# Altium project ADS1299-ESP32-V3.PrjPcb
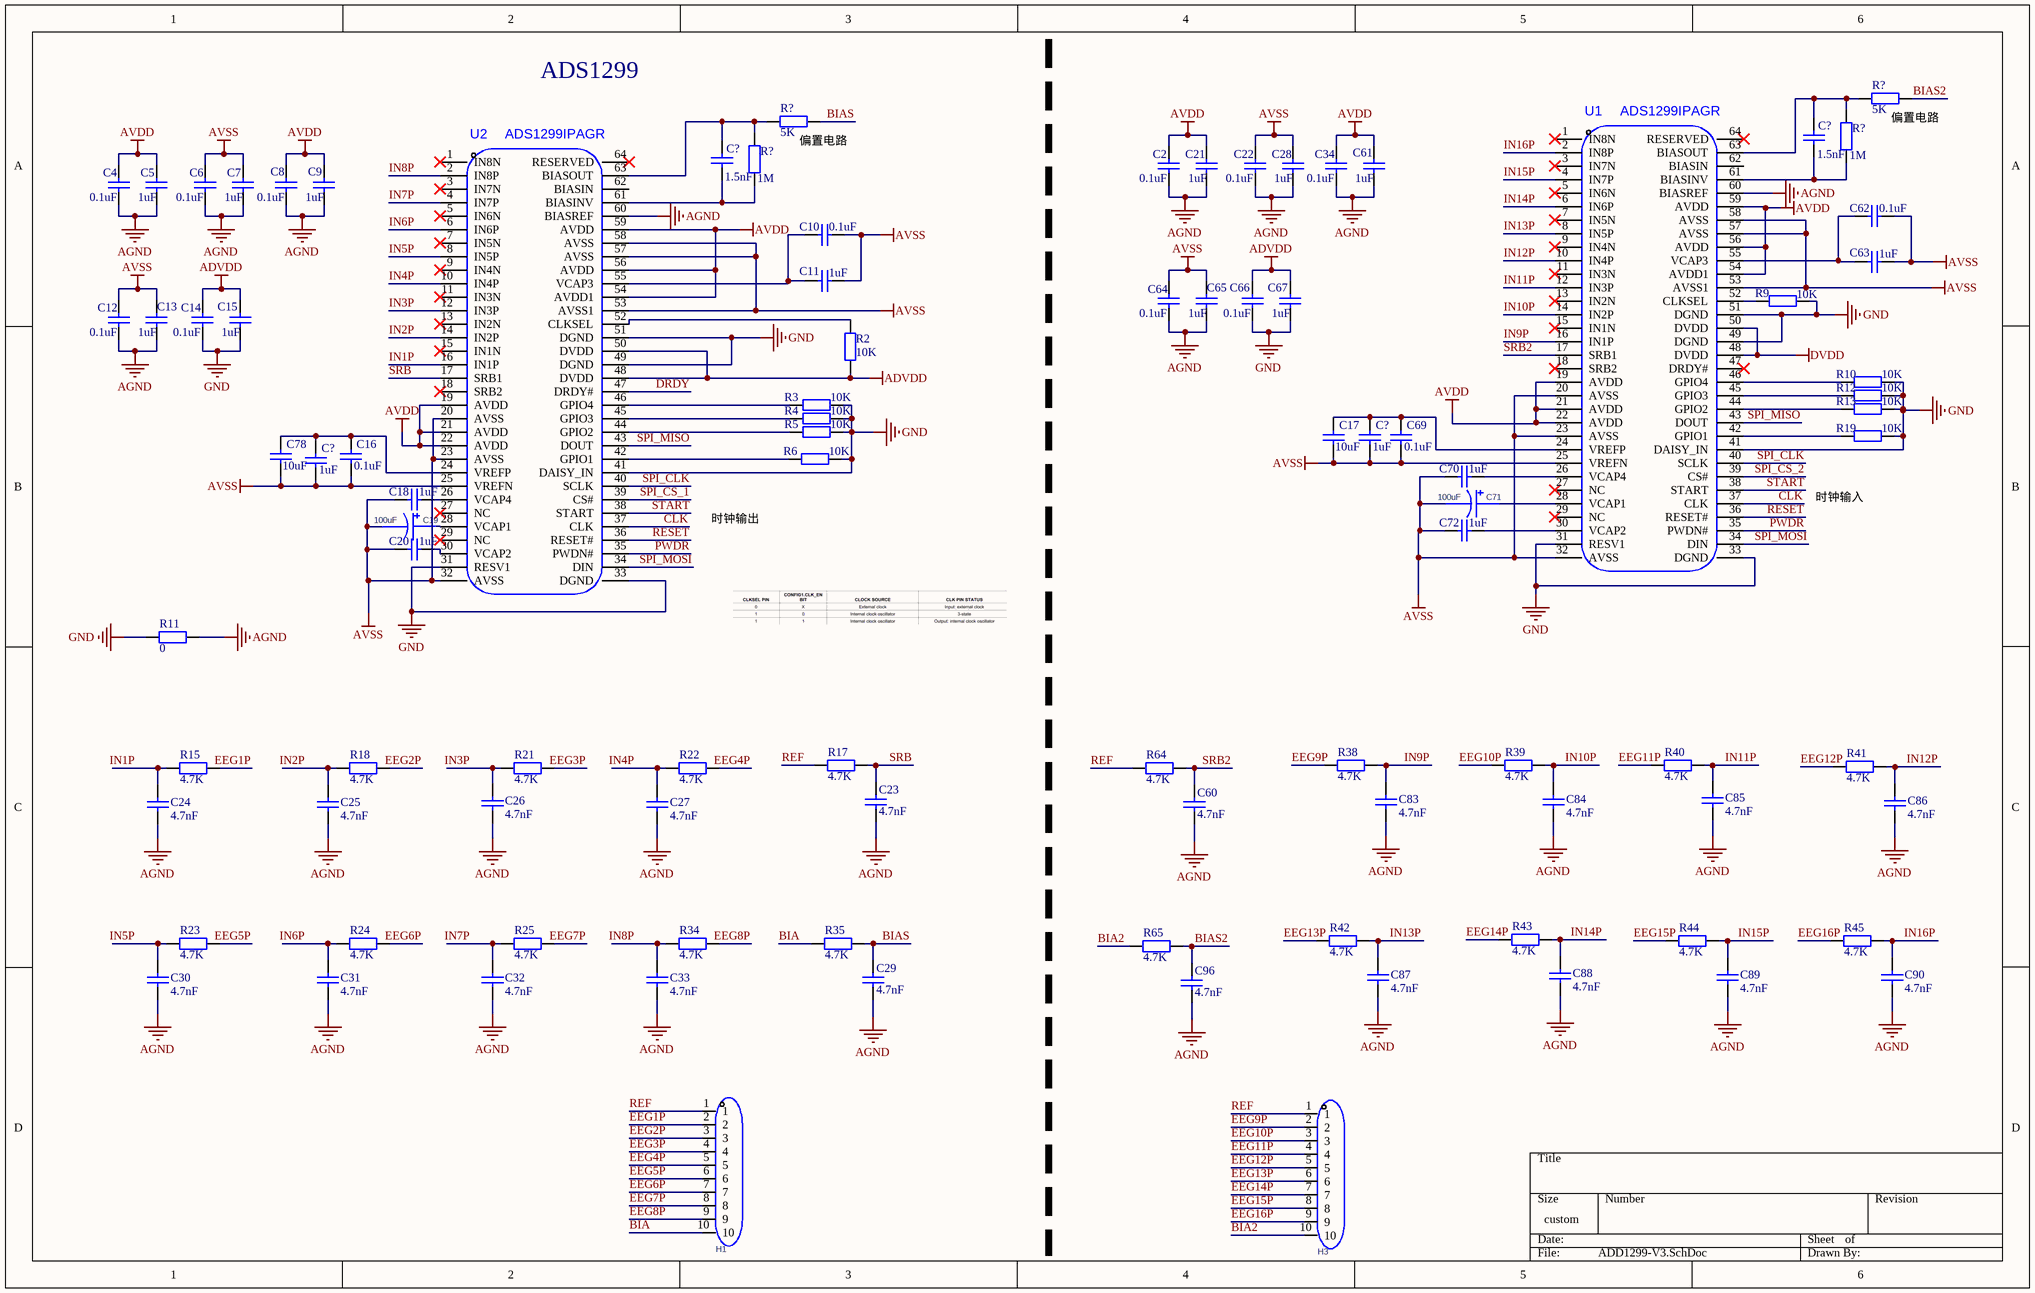
[diagram p0: ADD1299-V3.SchDoc]
3 sheets, 213 parts. Net scope: global (net labels, ports and power ports of the same name join across sheets).
Board file: ADS1299-V3.PcbDoc
Sheets:
  ADD1299-V3.SchDoc
  ESP32.SchDoc
  POWER.SchDoc

## Sheet ADD1299-V3.SchDoc
size 381 x 241 mm; SheetNumber: 1; SheetTotal: 3

### Parts
(Parts that share a designator on the sheet are numbered #1, #2 ... from top to bottom, then left to right.)
C2  0.1uF  [C0603]
C4  0.1uF  [C0603]
C5  1uF  [C0603]
C6  0.1uF  [C0603]
C7  1uF  [C0603]
C8  0.1uF  [C0603]
C9  1uF  [C0603]
C10  0.1uF  [C0603]
C11  1uF  [C0603]
C12  0.1uF  [C0603]
C13  1uF  [C0603]
C14  0.1uF  [C0603]
C15  1uF  [C0603]
C16  0.1uF  [C0603]
C17  10uF  [C0603]
C18  1uF  [C0603]
C19  100uF  [CASE-B_3528]
C20  1uF  [C0603]
C21  1uF  [C0603]
C22  0.1uF  [C0603]
C23  4.7nF  [C0603]
C24  4.7nF  [C0603]
C25  4.7nF  [C0603]
C26  4.7nF  [C0603]
C27  4.7nF  [C0603]
C28  1uF  [C0603]
C29  4.7nF  [C0603]
C30  4.7nF  [C0603]
C31  4.7nF  [C0603]
C32  4.7nF  [C0603]
C33  4.7nF  [C0603]
C34  0.1uF  [C0603]
C60  4.7nF  [C0603]
C61  1uF  [C0603]
C62  0.1uF  [C0603]
C63  1uF  [C0603]
C64  0.1uF  [C0603]
C65  1uF  [C0603]
C66  0.1uF  [C0603]
C67  1uF  [C0603]
C69  0.1uF  [C0603]
C70  1uF  [C0603]
C71  100uF  [CASE-B_3528]
C72  1uF  [C0603]
C78  10uF  [C0603]
C83  4.7nF  [C0603]
C84  4.7nF  [C0603]
C85  4.7nF  [C0603]
C86  4.7nF  [C0603]
C87  4.7nF  [C0603]
C88  4.7nF  [C0603]
C89  4.7nF  [C0603]
C90  4.7nF  [C0603]
C96  4.7nF  [C0603]
C?#1  1.5nF  [C0603]
C?#2  1.5nF  [C0603]
C?#3  1uF  [C0603]
C?#4  1uF  [C0603]
H1  PZ254V-11-10P  [HDR-TH_10P-P2.54-V-M]  (value not drawn)
H3  PZ254V-11-10P  [HDR-TH_10P-P2.54-V-M]  (value not drawn)
R2  10K  [R0603]
R3  10K  [R0603]
R4  10K  [R0603]
R5  10K  [R0603]
R6  10K  [R0603]
R9  10K  [R0603]
R10  10K  [R0603]
R11  0  [R0805]
R12  10K  [R0603]
R13  10K  [R0603]
R15  4.7K  [R0603]
R17  4.7K  [R0603]
R18  4.7K  [R0603]
R19  10K  [R0603]
R21  4.7K  [R0603]
R22  4.7K  [R0603]
R23  4.7K  [R0603]
R24  4.7K  [R0603]
R25  4.7K  [R0603]
R34  4.7K  [R0603]
R35  4.7K  [R0603]
R38  4.7K  [R0603]
R39  4.7K  [R0603]
R40  4.7K  [R0603]
R41  4.7K  [R0603]
R42  4.7K  [R0603]
R43  4.7K  [R0603]
R44  4.7K  [R0603]
R45  4.7K  [R0603]
R64  4.7K  [R0603]
R65  4.7K  [R0603]
R?#1  5K  [R0603]
R?#2  5K  [R0603]
R?#3  1M  [R0603]
R?#4  1M  [R0603]
U1  ADS1299IPAGR  [ADS1299]
U2  ADS1299IPAGR  [ADS1299]

### Nets
ADVDD: C14.1 C15.1 C66.1 C67.1 R2.1 U2.48(DVDD) U2.50(DVDD)
AGND: C2.2 C4.2 C5.2 C6.2 C7.2 C8.2 C9.2 C12.2 C13.2 C21.2 C22.2 C23.1 C24.2 C25.2 C26.2 C27.2 C28.2 C29.1 C30.2 C31.2 C32.2 C33.2 C34.2 C60.1 C61.2 C64.2 C65.2 C83.2 C84.2 C85.2 C86.2 C87.2 C88.2 C89.2 C90.2 C96.1 R11.1 U1.60(BIASREF) U2.60(BIASREF)
AVDD: C2.1 C4.1 C5.1 C8.1 C9.1 C21.1 C34.1 C61.1 U1.19(AVDD) U1.21(AVDD) U1.22(AVDD) U1.54(AVDD1) U1.56(AVDD) U1.59(AVDD) U2.19(AVDD) U2.21(AVDD) U2.22(AVDD) U2.54(AVDD1) U2.56(AVDD) U2.59(AVDD)
AVSS: C6.1 C7.1 C10.2 C11.2 C12.1 C13.1 C16.1 C17.1 C18.1 C19.2 C20.1 C22.1 C28.1 C62.2 C63.2 C64.1 C65.1 C69.1 C70.1 C71.2 C72.1 C78.1 C?#3.1 C?#4.1 U1.20(AVSS) U1.23(AVSS) U1.25(VREFN) U1.32(AVSS) U1.53(AVSS1) U1.57(AVSS) U1.58(AVSS) U2.20(AVSS) U2.23(AVSS) U2.25(VREFN) U2.32(AVSS) U2.53(AVSS1) U2.57(AVSS) U2.58(AVSS)
DVDD: U1.48(DVDD) U1.50(DVDD)
GND: C14.2 C15.2 C66.2 C67.2 R3.2 R4.2 R5.2 R6.2 R9.1 R10.2 R11.2 R12.2 R13.2 R19.2 U1.31(RESV1) U1.33(DGND) U1.41(DAISY_IN) U1.49(DGND) U1.51(DGND) U2.31(RESV1) U2.33(DGND) U2.41(DAISY_IN) U2.49(DGND) U2.51(DGND)
BIA: H1.10 R35.2
BIA2: H3.10 R65.2
BIAS: C29.2 R35.1 R?#2.2
BIAS2: C96.2 R65.1 R?#1.2
CLK: U1.37(CLK) U2.37(CLK)
DRDY: U2.47(DRDY#)
EEG1P: H1.2 R15.1
EEG2P: H1.3 R18.1
EEG3P: H1.4 R21.1
EEG4P: H1.5 R22.1
EEG5P: H1.6 R23.1
EEG6P: H1.7 R24.1
EEG7P: H1.8 R25.1
EEG8P: H1.9 R34.1
EEG9P: H3.2 R38.1
EEG10P: H3.3 R39.1
EEG11P: H3.4 R40.1
EEG12P: H3.5 R41.1
EEG13P: H3.6 R42.1
EEG14P: H3.7 R43.1
EEG15P: H3.8 R44.1
EEG16P: H3.9 R45.1
IN1P: C24.1 R15.2 U2.16(IN1P)
IN2P: C25.1 R18.2 U2.14(IN2P)
IN3P: C26.1 R21.2 U2.12(IN3P)
IN4P: C27.1 R22.2 U2.10(IN4P)
IN5P: C30.1 R23.2 U2.8(IN5P)
IN6P: C31.1 R24.2 U2.6(IN6P)
IN7P: C32.1 R25.2 U2.4(IN7P)
IN8P: C33.1 R34.2 U2.2(IN8P)
IN9P: C83.1 R38.2 U1.16(IN1P)
IN10P: C84.1 R39.2 U1.14(IN2P)
IN11P: C85.1 R40.2 U1.12(IN3P)
IN12P: C86.1 R41.2 U1.10(IN4P)
IN13P: C87.1 R42.2 U1.8(IN5P)
IN14P: C88.1 R43.2 U1.6(IN6P)
IN15P: C89.1 R44.2 U1.4(IN7P)
IN16P: C90.1 R45.2 U1.2(IN8P)
PWDR: U1.35(PWDN#) U2.35(PWDN#)
REF: H1.1 H3.1 R17.2 R64.2
RESET: U1.36(RESET#) U2.36(RESET#)
SPI_CLK: U1.40(SCLK) U2.40(SCLK)
SPI_CS_1: U2.39(CS#)
SPI_CS_2: U1.39(CS#)
SPI_MISO: U1.43(DOUT) U2.43(DOUT)
SPI_MOSI: U1.34(DIN) U2.34(DIN)
SRB: C23.2 R17.1 U2.17(SRB1)
SRB2: C60.2 R64.1 U1.17(SRB1)
START: U1.38(START) U2.38(START)
NetC10_1: C10.1 C11.1 U2.55(VCAP3)
NetC16_2: C16.2 C78.2 C?#4.2 U2.24(VREFP)
NetC17_2: C17.2 C69.2 C?#3.2 U1.24(VREFP)
NetC18_2: C18.2 U2.26(VCAP4)
NetC19_1: C19.1 U2.28(VCAP1)
NetC20_2: C20.2 U2.30(VCAP2)
NetC62_1: C62.1 C63.1 U1.55(VCAP3)
NetC70_2: C70.2 U1.26(VCAP4)
NetC71_1: C71.1 U1.28(VCAP1)
NetC72_2: C72.2 U1.30(VCAP2)
NetC?#1_1: C?#1.1 R?#1.1 R?#3.1 U1.63(BIASOUT)
NetC?#1_2: C?#1.2 R?#3.2 U1.61(BIASINV)
NetC?#2_1: C?#2.1 R?#2.1 R?#4.1 U2.63(BIASOUT)
NetC?#2_2: C?#2.2 R?#4.2 U2.61(BIASINV)
NetR2_2: R2.2 U2.52(CLKSEL)
NetR3_1: R3.1 U2.46(GPIO4)
NetR4_1: R4.1 U2.45(GPIO3)
NetR5_1: R5.1 U2.44(GPIO2)
NetR6_1: R6.1 U2.42(GPIO1)
NetR9_2: R9.2 U1.52(CLKSEL)
NetR10_1: R10.1 U1.46(GPIO4)
NetR12_1: R12.1 U1.45(GPIO3)
NetR13_1: R13.1 U1.44(GPIO2)
NetR19_1: R19.1 U1.42(GPIO1)

Not connected (* = marked no-connect by the designer): U1 1(IN8N)* 3(IN7N)* 5(IN6N)* 7(IN5N)* 9(IN4N)* 11(IN3N)* 13(IN2N)* 15(IN1N)* 18(SRB2)* 27(NC)* 29(NC)* 47(DRDY#)* 62(BIASIN) 64(RESERVED)*; U2 1(IN8N)* 3(IN7N)* 5(IN6N)* 7(IN5N)* 9(IN4N)* 11(IN3N)* 13(IN2N)* 15(IN1N)* 18(SRB2)* 27(NC)* 29(NC)* 62(BIASIN) 64(RESERVED)*

### Notes on the sheet
- ADS1299
- (near R?#2) 偏置电路
- (near R?#1) 偏置电路
- 时钟输入
- 时钟输出

### Library data of the parts
C2 C4 C6 C8 C10 C12 C14 C16 C22 C34 C62 C64 C66 C69 C?#3 C?#4 = C0603: CAP CER 0.1UF 50V, 10% X7R 0603; Value: 104; Published: 8-Jun-2000; LatestRevisionDate: 17-Jul-2002; LatestRevisionNote: Re-released for DXP Platform.; Publisher: Altium Limited
C5 C7 C9 C11 C13 C15 C18 C20 C21 C28 C61 C63 C65 C67 C70 C72 = C0603: CAP CER 1UF 25V, 10% X5R 0603; Value: 104; Published: 8-Jun-2000; LatestRevisionDate: 17-Jul-2002; LatestRevisionNote: Re-released for DXP Platform.; Publisher: Altium Limited
C17 = C0603: AP CER 10UF 10V, 10% X5R 0603; Value: 104; Published: 8-Jun-2000; LatestRevisionDate: 17-Jul-2002; LatestRevisionNote: Re-released for DXP Platform.; Publisher: Altium Limited
C19 C71 = T491B107K010AT: Manufacturer: KEMET(基美); Add into BOM: yes; Tolerance: ±10%; Rated Voltage: 10V; Equivalent Series Resistance(ESR): 1.2Ω@100kHz; Symbol: T491B107K010AT; Device: T491B107K010AT; LCSC Part Name: 100uF ±10% 10V; Supplier Part: C122271; Manufacturer Part: T491B107K010AT; Supplier Footprint: CASE-B-3528; JLCPCB Part Class: Extended Part; Datasheet: https://atta.szlcsc.com/upload/public/pdf/source/20171212/C146203_15130638656111177810.pdf; Supplier: LCSC; Convert to PCB: yes; Value: 100uF; Operating Temperature: -55℃~+125℃
C23-C27 C29-C33 C60 C83-C90 C96 = C0603: CAP CER 4700PF 50V, 10% X7R 0603; Value: 104; Published: 8-Jun-2000; LatestRevisionDate: 17-Jul-2002; LatestRevisionNote: Re-released for DXP Platform.; Publisher: Altium Limited
C78 = C0603: Capacitor; Value: 104; Published: 8-Jun-2000; LatestRevisionDate: 17-Jul-2002; LatestRevisionNote: Re-released for DXP Platform.; Publisher: Altium Limited
C?#1 C?#2 = C0603: CAP CER 1.5NF 25V, 10% X7R 0603; Value: 104; Published: 8-Jun-2000; LatestRevisionDate: 17-Jul-2002; LatestRevisionNote: Re-released for DXP Platform.; Publisher: Altium Limited
H1 H3 = PZ254V-11-10P: Manufacturer: XFCN(兴飞); Add into BOM: yes; Pin Structure: 1x10P; Pitch: 2.54mm; Circluar Pins/Square Pins: 方针; Symbol: PZ254V-11-10P; Device: PZ254V-11-10P; LCSC Part Name: 1x10P 间距:2.54mm 方针 直插; Supplier Part: C492409; Manufacturer Part: PZ254V-11-10P; Supplier Footprint: 插件,P=2.54mm; JLCPCB Part Class: Extended Part; Datasheet: https://atta.szlcsc.com/upload/public/pdf/source/20200309/C492409_129C9431BDD62EBBBD0A643B6AAB9FBD.pdf; Supplier: LCSC; Convert to PCB: yes; Row Spacing: -; Mounting Type: 直插; Number of Rows: 单排; Number of Pins: 10P; Current Rating: -; Voltage Rating (Max): -; Length of Mating Pin: 6mm; Insulation Height: 2.5mm; Length of End Connection Pin: 3mm; Contact Material: 黄铜; Contact Plating: -; Operating Temperature: -40℃~+105℃; Color: 黑色
R2-R6 R9 R10 R12 R13 R19 = R0603: RES 10.0K OHM 1/10W 1% 0603 SMD; Published: 8-Jun-2000; LatestRevisionDate: 17-Jul-2002; LatestRevisionNote: Re-released for DXP Platform.; Publisher: Altium Limited
R11 = R0805: 磁珠; Published: 8-Jun-2000; LatestRevisionDate: 17-Jul-2002; LatestRevisionNote: Re-released for DXP Platform.; Publisher: Altium Limited
R15 R17 R18 R21-R25 R34 R35 R38-R45 R64 R65 = R0603: RES 4.7K OHM 1/10W 1% 0603 SMD; Published: 8-Jun-2000; LatestRevisionDate: 17-Jul-2002; LatestRevisionNote: Re-released for DXP Platform.; Publisher: Altium Limited
R?#1 R?#2 = R0603: 薄膜电阻 5kΩ ±0.1% 100mW; Published: 8-Jun-2000; LatestRevisionDate: 17-Jul-2002; LatestRevisionNote: Re-released for DXP Platform.; Publisher: Altium Limited
R?#3 R?#4 = R0603: RES 1M OHM 1/8W 5% 0603 SMD; Published: 8-Jun-2000; LatestRevisionDate: 17-Jul-2002; LatestRevisionNote: Re-released for DXP Platform.; Publisher: Altium Limited
U1 U2 = ADS1299IPAGR: Manufacturer: TI(德州仪器); Add into BOM: yes; Supply Voltage: 5V；1.8V~3.6V; Symbol: ADS1299IPAGR; Device: ADS1299IPAGR; LCSC Part Name: ADS1299-x 低噪声、4/6/8通道、24bit 、同时采样模数转换器，用于EEG和生物电bit 测量; Supplier Part: C476817; Manufacturer Part: ADS1299IPAGR; Supplier Footprint: TQFP-64(10x10); JLCPCB Part Class: Extended Part; Datasheet: https://www.ti.com/cn/lit/gpn/ads1299; Supplier: LCSC; Convert to PCB: yes

## Sheet ESP32.SchDoc
size 381 x 241 mm; SheetNumber: 2; SheetTotal: 3
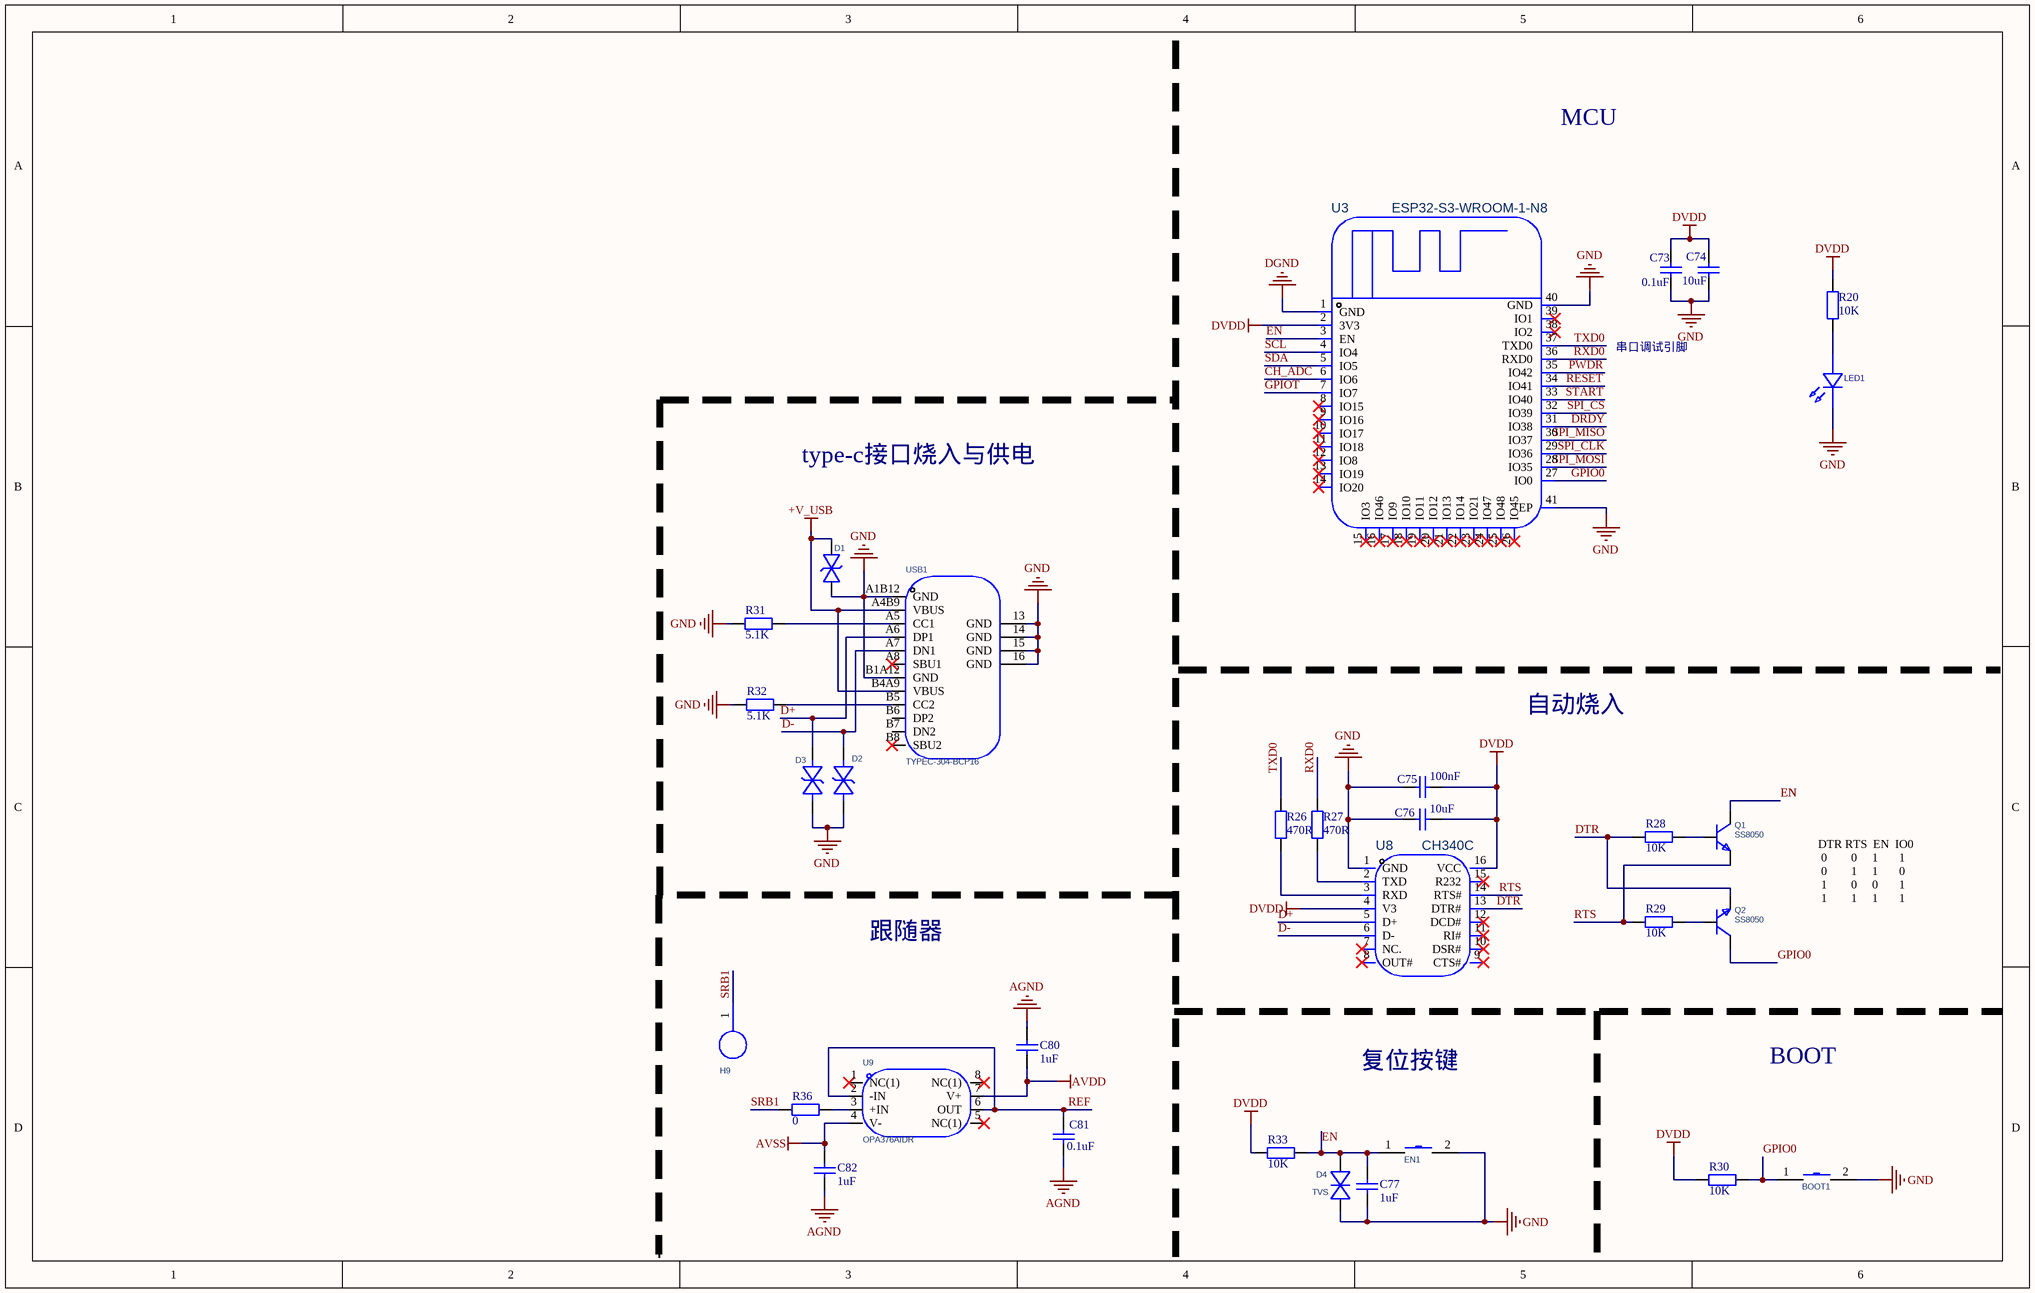
[diagram p1: ESP32.SchDoc]

### Parts
BOOT1  TS-1101-C-W  [SW-SMD_L6.0-W3.3-LS8.0]  (value not drawn)
C73  0.1uF  [C0603]
C74  10uF  [C0603]
C75  100nF  [C0603]
C76  10uF  [C0603]
C77  1uF  [C0603]
C80  1uF  [C0603]
C81  0.1uF  [C0603]
C82  1uF  [C0603]
D1  SMBJ5.0CA  [SMB_L4.5-W3.6-LS5.2-BI]  (value not drawn)
D2  ESD8011MUT5G(ES)  [X3-DFN0603-2_L0.6-W0.3-BI]  (value not drawn)
D3  ESD8011MUT5G(ES)  [X3-DFN0603-2_L0.6-W0.3-BI]  (value not drawn)
D4  TVS  [SMB_L4.3-W3.6-LS5.4-BI]
EN1  TS-1101-C-W  [SW-SMD_L6.0-W3.3-LS8.0]  (value not drawn)
H9  PZ254V-11-01P  [HDR-TH_1P-P2.54-V-M]  (value not drawn)
LED1  XL-1608SURC-06  [LED0603-RD_RED]  (value not drawn)
Q1  SS8050  [SOT-23-3_L2.9-W1.3-P1.90-LS2.4-BR]
Q2  SS8050  [SOT-23-3_L2.9-W1.3-P1.90-LS2.4-BR]
R20  10K  [R0603]
R26  470R  [R0603]
R27  470R  [R0603]
R28  10K  [R0603]
R29  10K  [R0603]
R30  10K  [R0603]
R31  5.1K  [R0603]
R32  5.1K  [R0603]
R33  10K  [R0603]
R36  0  [R0805]
U3  ESP32-S3-WROOM-1-N8  [WIFIM-SMD_ESP32-S3-WROOM-1-N8]
U8  CH340C  [SOP-16_L10.0-W3.9-P1.27-LS6.0-BL]
U9  OPA376AIDR  [SOIC-8_L4.9-W3.9-P1.27-LS6.0-BL]
USB1  TYPEC-304-BCP16  [USB-C-SMD_TYPEC-304-BCP16]

### Nets
+V_USB: D1.2 USB1.A4B9(VBUS) USB1.B4A9(VBUS)
AGND: C80.2 C81.1 C82.2
AVDD: C80.1 U9.7(V+)
AVSS: C82.1 U9.4(V-)
DGND: U3.1(GND)
DVDD: C73.1 C74.1 C75.2 C76.2 R20.2 R30.1 R33.1 U3.2(3V3) U8.4(V3) U8.16(VCC)
GND: BOOT1.2 C73.2 C74.2 C75.1 C76.1 C77.2 D1.1 D2.1(C) D3.1(C) D4.1(C) EN1.2 LED1.1(K) R31.2 R32.2 U3.40(GND) U3.41(EP) U8.1(GND) USB1.13(GND) USB1.14(GND) USB1.15(GND) USB1.16(GND) USB1.A1B12(GND) USB1.B1A12(GND)
CH_ADC: U3.6(IO6)
D+: D3.2(A) U8.5(D+) USB1.A6(DP1)
D-: D2.2(A) U8.6(D-) USB1.A7(DN1)
DRDY: U3.31(IO38)
DTR: Q2.2(E) R28.1 U8.13(DTR#)
EN: C77.1 D4.2(A) EN1.1 Q1.3(C) R33.2 U3.3(EN)
GPIO0: BOOT1.1 Q2.3(C) R30.2 U3.27(IO0)
GPIOT: U3.7(IO7)
PWDR: U3.35(IO42)
REF: C81.2 U9.2(-IN) U9.6(OUT)
RESET: U3.34(IO41)
RTS: Q1.2(E) R29.1 U8.14(RTS#)
RXD0: R27.2 U3.36(RXD0)
SCL: U3.4(IO4)
SDA: U3.5(IO5)
SPI_CLK: U3.29(IO36)
SPI_CS: U3.32(IO39)
SPI_MISO: U3.30(IO37)
SPI_MOSI: U3.28(IO35)
SRB1: H9.1 R36.2
START: U3.33(IO40)
TXD0: R26.2 U3.37(TXD0)
NetLED1_2: LED1.2(A) R20.1
NetQ1_1: Q1.1(B) R28.2
NetQ2_1: Q2.1(B) R29.2
NetR26_1: R26.1 U8.3(RXD)
NetR27_1: R27.1 U8.2(TXD)
NetR31_1: R31.1 USB1.A5(CC1)
NetR32_1: R32.1 USB1.B5(CC2)
NetR36_1: R36.1 U9.3(+IN)

Not connected (* = marked no-connect by the designer): U3 8(IO15)* 9(IO16)* 10(IO17)* 11(IO18)* 12(IO8)* 13(IO19)* 14(IO20)* 15(IO3)* 16(IO46)* 17(IO9)* 18(IO10)* 19(IO11)* 20(IO12)* 21(IO13)* 22(IO14)* 23(IO21)* 24(IO47)* 25(IO48)* 26(IO45)* 38(IO2)* 39(IO1)*; U8 7(NC.)* 8(OUT#)* 9(CTS#)* 10(DSR#)* 11(RI#)* 12(DCD#)* 15(R232)*; U9 1(NC(1))* 5(NC(1))* 8(NC(1))*; USB1 A8(SBU1)* B6(DP2) B7(DN2) B8(SBU2)*

### Notes on the sheet
- MCU
- 串口调试引脚
- type-c接口烧入与供电
- 自动烧入
- DTR RTS  EN  IO0
  0        0     1       1
  0        1     1       0
  1        0     0       1
  1        1     1       1
- 跟随器
- 复位按键
- BOOT

### Library data of the parts
BOOT1 EN1 = TS-1101-C-W: Manufacturer: XKB Connectivity(中国星坤); Add into BOM: yes; Circuit: 单刀单掷; Actuator Style: 矩形按钮; Operating Force: 260gf; Switch Length: 6mm; Switch Width: 3.6mm; Switch Height: 2.5mm; Strike Gundam: 不带; Contact Current: 50mA; Voltage Rating (DC): 12V; Actuator/Cap Color: 白色带淡绿; With Lamp: 无; Mechanical Life: 5万次; Symbol: TS-1101-C-W; Device: TS-1101-C-W; LCSC Part Name: 6*3.6*2.5mm 立贴 轻触开关; Supplier Part: C318938; Manufacturer Part: TS-1101-C-W; Supplier Footprint: SMD; JLCPCB Part Class: Extended Part; Datasheet: https://atta.szlcsc.com/upload/public/pdf/source/20200227/C318938_C2E53B1EEDE37D980A33616AC086DE53.pdf; Supplier: LCSC; Convert to PCB: yes; Mounting Style: 立贴; Voltage Rating (AC): -; Power Rating: -; Insulation Resistance: -; IP Rating: -; Pin Style: -; Operating Temperature: -30℃~+85℃
C73 C81 = C0603: as C2 on sheet ADD1299-V3; Published: 8-Jun-2000; LatestRevisionDate: 17-Jul-2002; LatestRevisionNote: Re-released for DXP Platform.; Publisher: Altium Limited
C74 C75 = C0603: as C5 on sheet ADD1299-V3; Published: 8-Jun-2000; LatestRevisionDate: 17-Jul-2002; LatestRevisionNote: Re-released for DXP Platform.; Publisher: Altium Limited
C76 = C0603: CAP CER 10UF 25V, 10% X5R 0603; Value: 104; Published: 8-Jun-2000; LatestRevisionDate: 17-Jul-2002; LatestRevisionNote: Re-released for DXP Platform.; Publisher: Altium Limited
C77 C80 C82 = C0603: CAP CER 1UF 25V, 10% X7R 0603; Value: 104; Published: 8-Jun-2000; LatestRevisionDate: 17-Jul-2002; LatestRevisionNote: Re-released for DXP Platform.; Publisher: Altium Limited
D1 = SMBJ5.0CA_C19077559: PWR; Manufacturer: 宏嘉诚; Add into BOM: yes; Polarity: 双向; Reverse Stand-Off Voltage (Vrwm): 5V; Clamping Voltage: 9.2V; Peak Pulse Current (Ipp): 65.22A; Peak Pulse Power Dissipation (Ppp): 600W; Voltage - Breakdown: 7V; Reverse Leakage Current (Ir): 800uA; Type: TVS; Symbol: SMBJ5.0CA_C19077559; Device: SMBJ5.0CA_C19077559; LCSC Part Name: SMBJ5.0CA; Supplier Part: C19077559; Manufacturer Part: SMBJ5.0CA; Supplier Footprint: SMB; JLCPCB Part Class: Extended Part; Datasheet: https://atta.szlcsc.com/upload/public/pdf/source/20250107/474F05451FC8AB27D7FA0238914F96F6.pdf; Supplier: LCSC; Convert to PCB: yes; Operating Temperature: -
D2 D3 = ESD8011MUT5G(ES): 高速低电容; Manufacturer: ElecSuper(静芯微); Add into BOM: yes; Reverse Stand-Off Voltage (Vrwm): 5V; Clamping Voltage: 5.5V; Peak Pulse Current (Ipp): 4.5A; Peak Pulse Power Dissipation (Ppp): 40W; Voltage - Breakdown: 7.8V; Reverse Leakage Current (Ir): 100nA; Symbol: ESD8011MUT5G(ES); Device: ESD8011MUT5G(ES); LCSC Part Name: 极低电容0.1pF，1.0/1.5/3.3/5.0V深回扫超低电容超低钳位单路双向ESD防护器件，4.5A、10kV、0.1pF；Thounderbolt5、USB4.0 80G-120G信号线超高速通讯防护。; Supplier Part: C42400200; Manufacturer Part: ESD8011MUT5G(ES); Supplier Footprint: DFN0603-2L; Datasheet: https://atta.szlcsc.com/upload/public/pdf/source/20241127/8BB72D6002C01DA826D69227B9BFDA64.pdf; Supplier: LCSC; Convert to PCB: yes; Operating Temperature: -50℃~+125℃
D4 = SMBJ3.3CA_C19077557: 3.3V KEY; Manufacturer: 宏嘉诚; Add into BOM: yes; Polarity: 双向; Clamping Voltage: 8V; Peak Pulse Current (Ipp): 75A; Peak Pulse Power Dissipation (Ppp): 600W; Voltage - Breakdown: 6.5V; Reverse Leakage Current (Ir): 600uA; Symbol: SMBJ3.3CA_C19077557; Device: SMBJ3.3CA_C19077557; LCSC Part Name: SMBJ3.3CA; Supplier Part: C19077557; Manufacturer Part: SMBJ3.3CA; Supplier Footprint: SMB; JLCPCB Part Class: Extended Part; Datasheet: https://atta.szlcsc.com/upload/public/pdf/source/20250107/474F05451FC8AB27D7FA0238914F96F6.pdf; Supplier: LCSC; Convert to PCB: yes; Reverse Stand-Off Voltage (Vrwm): 3.3V; Operating Temperature: -; Type: TVS
H9 = PZ254V-11-01P: Manufacturer: XFCN(兴飞); Add into BOM: yes; Pin Structure: 1x1P; Pitch: 2.54mm; Circluar Pins/Square Pins: 方针; Symbol: PZ254V-11-01P; Device: PZ254V-11-01P; LCSC Part Name: 1x1P 间距:2.54mm 方针 直插; Supplier Part: C492400; Manufacturer Part: PZ254V-11-01P; Supplier Footprint: 插件,P=2.54mm; JLCPCB Part Class: Extended Part; Datasheet: https://atta.szlcsc.com/upload/public/pdf/source/20200309/C492400_46876A5B545F5AE6B8D4A09C46E276E8.pdf; Supplier: LCSC; Convert to PCB: yes; Row Spacing: -; Mounting Type: 直插; Number of Rows: 单排; Number of Pins: 1P; Current Rating: -; Voltage Rating (Max): -; Length of Mating Pin: 6mm; Insulation Height: 2.5mm; Length of End Connection Pin: 3mm; Contact Material: 黄铜; Contact Plating: -; Operating Temperature: -40℃~+105℃; Color: 黑色
LED1 = XL-1608SURC-06: Manufacturer: XINGLIGHT(成兴光); Add into BOM: yes; Illumination Color: 红色; Voltage - Forward(Vf): 2.3V; Power(Watts): 50mW; Forward Current: 20mA; Wavelength - Dominant: 620nm~630nm; Peak Wavelength: 625nm; Lens Color: 无色透明透镜; Luminous Intensity: 225mcd; Viewing Angle: 120°; Mounting Sytle: 正贴; Symbol: XL-1608SURC-06; Device: XL-1608SURC-06; LCSC Part Name: XL-1608SURC-06; Supplier Part: C965799; Manufacturer Part: XL-1608SURC-06; Supplier Footprint: 0603; JLCPCB Part Class: Extended Part; Datasheet: https://atta.szlcsc.com/upload/public/pdf/source/20250213/F9766CE804AF391355DCDD48DB3E0DAB.pdf; Supplier: LCSC; Convert to PCB: yes; Lamp Holder Type: -; Diode Configuration: -; Color Temperature: -; Operating Temperature: -20℃~+85℃
Q1 Q2 = SS8050_C7420370: NPN; Manufacturer: 宏嘉诚; Add into BOM: yes; Current - Collector(Ic): 1.5A; Collector - Emitter Voltage VCEO: 25V; Pd - Power Dissipation: 300mW; DC Current Gain: 120@100mA,1.0V; Transition frequency(fT): 100MHz; Current - Collector Cutoff: 100nA; Vce Saturation(VCE(sat)): 500mV; Symbol: SS8050_C7420370; Device: SS8050_C7420370; LCSC Part Name: H档 200-350; Supplier Part: C7420370; Manufacturer Part: SS8050; Supplier Footprint: SOT-23; JLCPCB Part Class: Extended Part; Datasheet: https://atta.szlcsc.com/upload/public/pdf/source/20250205/5DB94E86981B5B1A1866D18E379C0D4F.pdf; Supplier: LCSC; Convert to PCB: yes; type: NPN; Operating Temperature: -55℃~+150℃
R20 R26-R33 = R0603: Resistor; Published: 8-Jun-2000; LatestRevisionDate: 17-Jul-2002; LatestRevisionNote: Re-released for DXP Platform.; Publisher: Altium Limited
R36 = R0805: RES 0 OHM 1/8W 1% 0805 SMD; Published: 8-Jun-2000; LatestRevisionDate: 17-Jul-2002; LatestRevisionNote: Re-released for DXP Platform.; Publisher: Altium Limited
U3 = ESP32-S3-WROOM-1-N8: Manufacturer: ESPRESSIF(乐鑫); Add into BOM: yes; Core Processor: ESP32-S3芯片; Support Interface: I2C；GPIO；SPI；PWM；ADC；UART；USB；I2S; Value: 2.4GHz; Symbol: ESP32-S3-WROOM-1-N8; Device: ESP32-S3-WROOM-1-N8; LCSC Part Name: 通用型Wi-Fi+低功耗蓝牙MCU模组; Supplier Part: C2913198; Manufacturer Part: ESP32-S3-WROOM-1-N8; Supplier Footprint: SMD,18x25.5mm; JLCPCB Part Class: Extended Part; Datasheet: https://atta.szlcsc.com/upload/public/pdf/source/20221026/9A44C6421221D672346AAE72DF9F8146.pdf; Supplier: LCSC; Convert to PCB: yes
U8 = CH340C: Manufacturer: WCH(南京沁恒); Add into BOM: yes; Applications Function: 收发器; Protocol: USB 2.0; Voltage - Supply: 3.3V；5V; Data Rate: 2Mbps; Symbol: CH340C; Device: CH340C; LCSC Part Name: CH340C; Supplier Part: C84681; Manufacturer Part: CH340C; Supplier Footprint: SOP-16; JLCPCB Part Class: Extended Part; Datasheet: https://atta.szlcsc.com/upload/public/pdf/source/20240619/63986D8440D4E5267A77ACD891CC4DE3.pdf; Supplier: LCSC; Convert to PCB: yes
U9 = OPA376AIDR: Manufacturer: TI(德州仪器); Add into BOM: yes; Number of Channels: 单路; Gain Bandwidth Product: 5.5MHz; Ib - Input Bias Current: 0.2pA; Slew Rate: 2V/us; Output Current: 50mA; Symbol: OPA376AIDR; Device: OPA376AIDR; LCSC Part Name: OPA376AIDR; Supplier Part: C2058339; Manufacturer Part: OPA376AIDR; Supplier Footprint: SOIC-8; JLCPCB Part Class: Extended Part; Datasheet: https://www.ti.com/cn/lit/gpn/opa2376; Supplier: LCSC; Convert to PCB: yes; Output Type: -; Rail to Rail: -; Operating Temperature: -40℃~+125℃
USB1 = TYPEC-304-BCP16_C720629: Manufacturer: XUNPU(讯普); Add into BOM: yes; Connector Type: Type-C; Protocol Standard: USB 3.1; Gender: 母; Number of Contacts: 16P; Number of Ports: 1; Current Rating-Power: 3A; Symbol: TYPEC-304-BCP16; Device: TYPEC-304-BCP16_C720629; LCSC Part Name: 停产 Type-C 母 卧贴; Supplier Part: C720629; Manufacturer Part: TYPEC-304-BCP16; Supplier Footprint: SMD; JLCPCB Part Class: Extended Part; Datasheet: https://atta.szlcsc.com/upload/public/pdf/source/20220210/1FE0FEFF7D6A20C111212527D3DED014.pdf; Supplier: LCSC; Convert to PCB: yes; Mounting Type: 卧贴; Operating Temperature: -25℃~+85℃

## Sheet POWER.SchDoc
size 381 x 241 mm; SheetNumber: 3; SheetTotal: 3
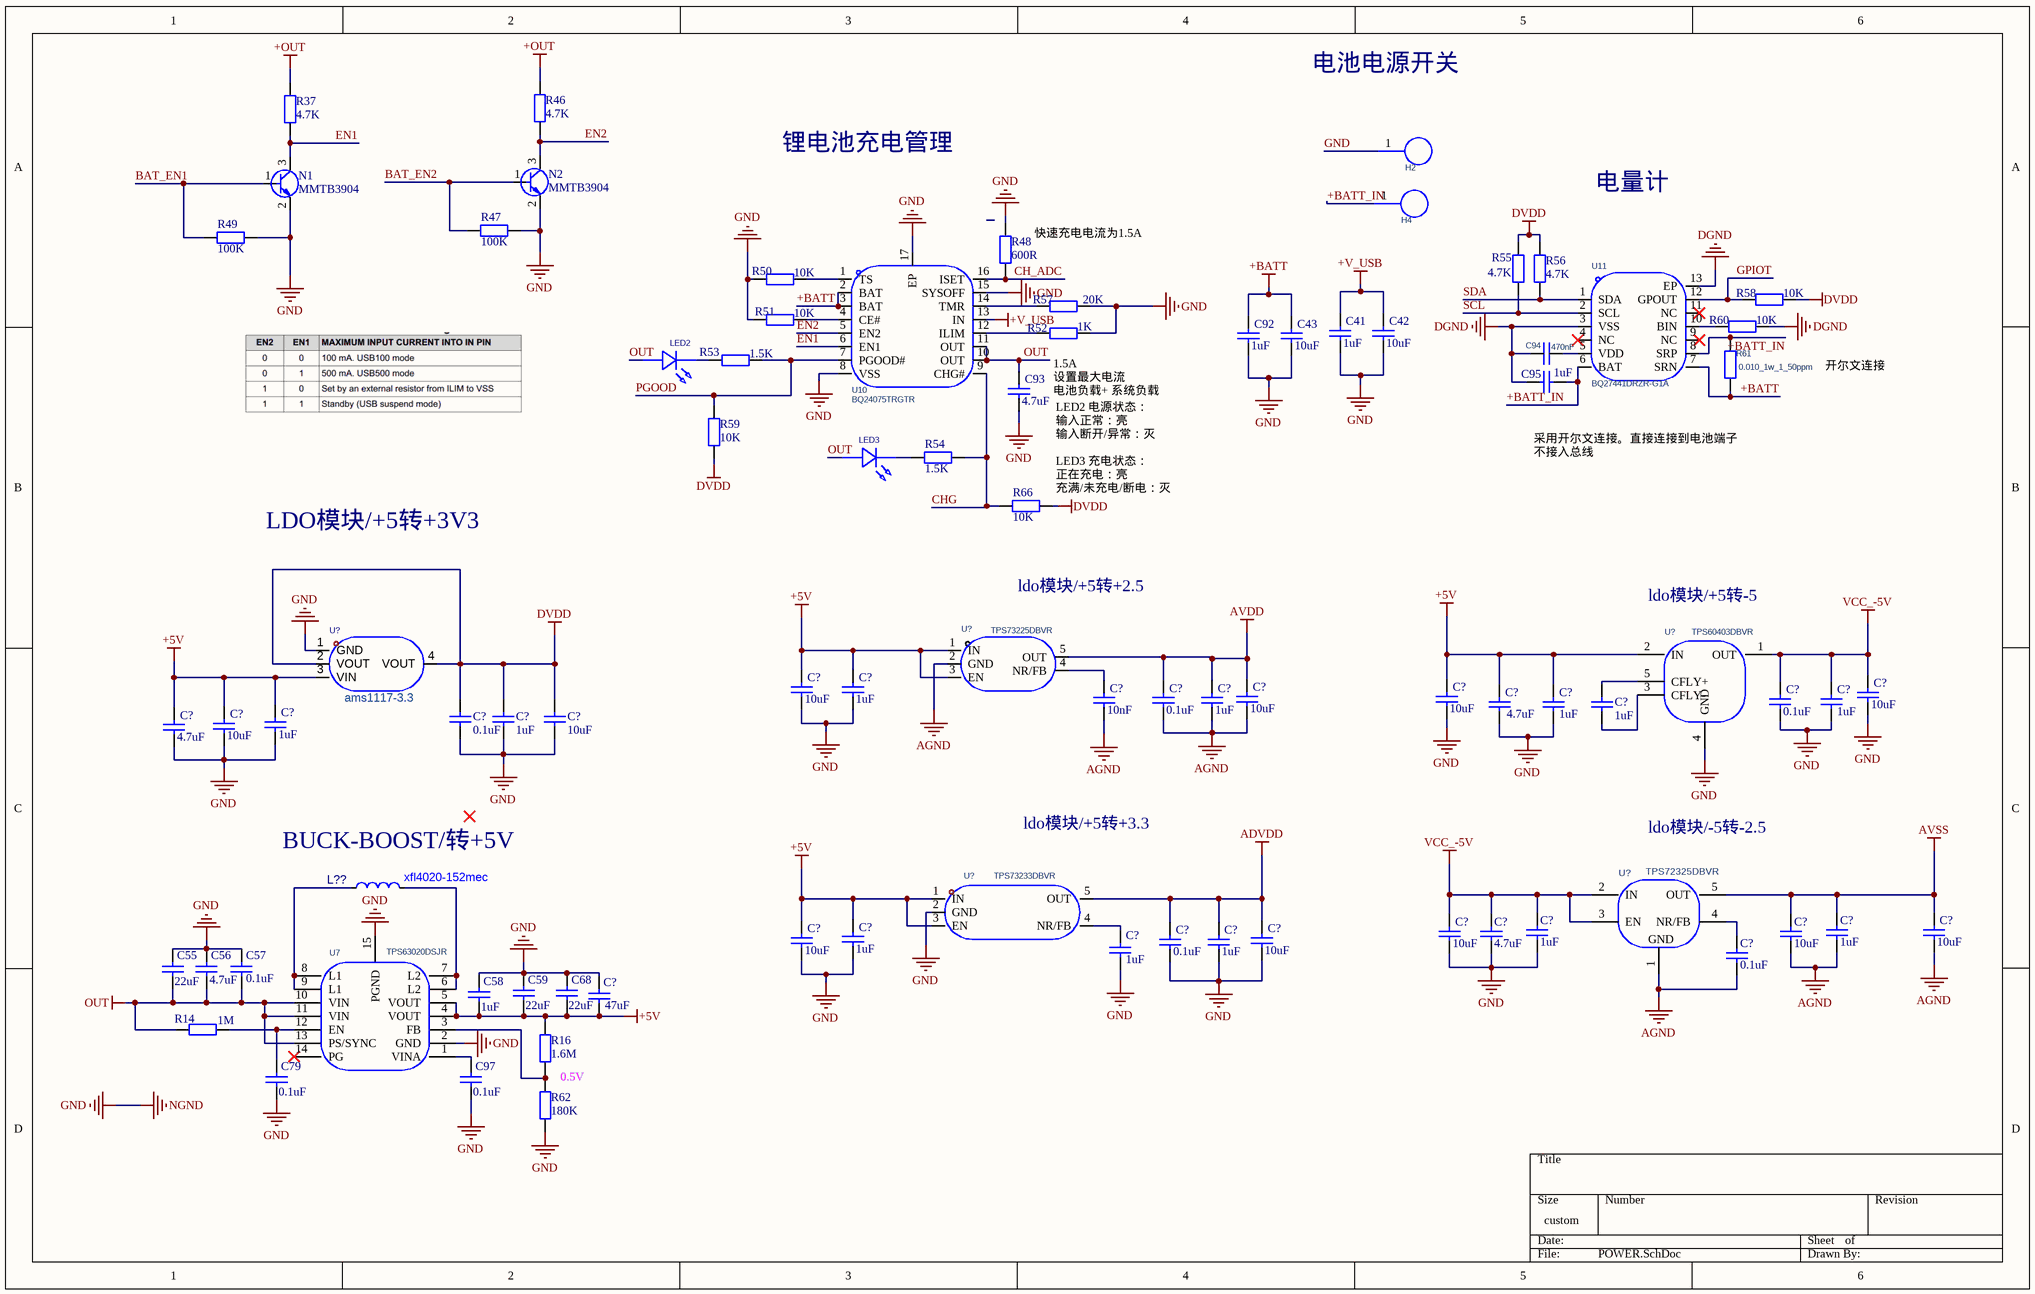
[diagram p2: POWER.SchDoc]

### Parts
(Parts that share a designator on the sheet are numbered #1, #2 ... from top to bottom, then left to right.)
C41  1uF  [C0603]
C42  10uF  [C0603]
C43  10uF  [C0603]
C55  22uF  [C0603]
C56  4.7uF  [C0603]
C57  0.1uF  [C0603]
C58  1uF  [C0603]
C59  22uF  [C0603]
C68  22uF  [C0603]
C79  0.1uF  [C0603]
C92  1uF  [C0603]
C93  4.7uF  [C0603]
C94  470nF  [C1206]
C95  1uF  [C0603]
C97  0.1uF  [C0603]
C?#5  10uF  [C0603]
C?#6  1uF  [C0603]
C?#7  10uF  [C0603]
C?#8  10nF  [C0603]
C?#9  0.1uF  [C0603]
C?#10  1uF  [C0603]
C?#11  10uF  [C0603]
C?#12  10uF  [C0603]
C?#13  4.7uF  [C0603]
C?#14  1uF  [C0603]
C?#15  1uF  [C0603]
C?#16  0.1uF  [C0603]
C?#17  1uF  [C0603]
C?#18  1uF  [C0603]
C?#19  0.1uF  [C0603]
C?#20  1uF  [C0603]
C?#21  10uF  [C0603]
C?#22  4.7uF  [C0603]
C?#23  10uF  [C0603]
C?#24  4.7uF  [C0603]
C?#25  1uF  [C0603]
C?#26  10uF  [C0603]
C?#27  1uF  [C0603]
C?#28  10uF  [C0603]
C?#29  10uF  [C0603]
C?#30  10uF  [C0603]
C?#31  1uF  [C0603]
C?#32  10uF  [C0603]
C?#33  0.1uF  [C0603]
C?#34  1uF  [C0603]
C?#35  0.1uF  [C0603]
C?#36  1uF  [C0603]
C?#37  47uF  [C0603]
H2  PZ254V-11-01P  [HDR-TH_1P-P2.54-V-M]  (value not drawn)
H4  PZ254V-11-01P  [HDR-TH_1P-P2.54-V-M]  (value not drawn)
L??  xfl4020-152mec  [IND-SMD_L4.0-W4.0-A]
LED2  XL-1608SURC-06  [LED0603-RD_RED]  (value not drawn)
LED3  XL-1608SURC-06  [LED0603-RD_RED]  (value not drawn)
N1  MMTB3904  [SOT-23-3_L2.9-W1.3-P1.90-LS2.4-BR - duplicate]
N2  MMTB3904  [SOT-23-3_L2.9-W1.3-P1.90-LS2.4-BR - duplicate]
R14  1M  [R0603]
R16  1.6M  [R0603]
R37  4.7K  [R0603]
R46  4.7K  [R0603]
R47  100K  [R0603]
R48  600R  [R0603]
R49  100K  [R0603]
R50  10K  [R0603]
R51  10K  [R0603]
R52  1K  [R0603]
R53  1.5K  [R0603]
R54  1.5K  [R0603]
R55  4.7K  [R0603]
R56  4.7K  [R0603]
R57  20K  [R0603]
R58  10K  [R0603]
R59  10K  [R0603]
R60  10K  [R0603]
R61  0.010_1w_1_50ppm  [R2512]
R62  180K  [R0603]
R66  10K  [R0603]
U7  TPS63020DSJR  [VSON-14_L4.0-W3.0-P0.50-BL-EP_TI_DSJ]
U10  BQ24075TRGTR  [VQFN-16_L3.0-W3.0-P0.50-TL-EP1.7]
U11  BQ27441DRZR-G1A  [SON-12_L4.0-W2.5-P0.40-BL-EP]
U?#1  ams1117-3.3  [SOT-223-3_L6.5-W3.4-P2.30-LS7.0-BR]
U?#2  TPS73225DBVR  [SOT-23-5_L2.9-W1.6-P0.95-LS2.8-TL]
U?#3  TPS60403DBVR  [SOT-23-5_L3.0-W1.7-P0.95-LS2.8-BR]
U?#4  TPS73233DBVR  [SOT-23-5_L3.0-W1.7-P0.95-LS2.8-BL]
U?#5  TPS72325DBVR  [SOT-23-5_L3.0-W1.7-P0.95-LS2.8-BR]

### Nets
+5V: C58.1 C59.1 C68.1 C?#5.2 C?#6.2 C?#12.2 C?#13.2 C?#14.2 C?#18.2 C?#22.2 C?#23.2 C?#30.2 C?#31.2 C?#37.1 R16.2 U7.4(VOUT) U7.5(VOUT) U?#1.3(VIN) U?#2.1(IN) U?#2.3(EN) U?#3.2(IN) U?#4.1(IN) U?#4.3(EN)
+BATT: C43.2 C92.2 R61.1 U10.2(BAT) U10.3(BAT) U11.7(SRN)
+OUT: R37.2 R46.2
+V_USB: C41.2 C42.2 U10.13(IN)
ADVDD: C?#32.2 C?#33.2 C?#34.2 U?#4.5(OUT)
AGND: C?#8.1 C?#9.1 C?#10.1 C?#11.1 C?#26.2 C?#27.2 C?#29.1 C?#35.2 U?#2.2(GND) U?#5.1(GND)
AVDD: C?#9.2 C?#10.2 C?#11.2 U?#2.5(OUT)
AVSS: C?#26.1 C?#27.1 C?#29.2 U?#5.5(OUT)
DGND: C94.2 C95.2 R60.1 U11.3(VSS) U11.13(EP)
DVDD: C?#19.2 C?#20.2 C?#21.2 R55.1 R56.1 R58.1 R59.2 R66.2 U?#1.2(VOUT) U?#1.4(VOUT)
GND: C41.1 C42.1 C43.1 C55.2 C56.1 C57.1 C58.2 C59.2 C68.2 C79.1 C92.1 C93.1 C97.1 C?#5.1 C?#6.1 C?#7.1 C?#12.1 C?#13.1 C?#14.1 C?#16.1 C?#17.1 C?#18.1 C?#19.1 C?#20.1 C?#21.1 C?#22.1 C?#23.1 C?#24.2 C?#25.2 C?#28.1 C?#30.1 C?#31.1 C?#32.1 C?#33.1 C?#34.1 C?#36.1 C?#37.2 H2.1 N1.2 N2.2 R47.1 R48.1 R49.1 R50.2 R51.2 R52.1 R57.1 R62.1 U7.2(GND) U7.15(PGND) U10.8(VSS) U10.15(SYSOFF) U10.17(EP) U?#1.1(GND) U?#3.4(GND) U?#4.2(GND)  [also labelled NGND]
OUT: C55.1 C56.2 C57.2 C93.2 LED2.2(A) LED3.2(A) R14.1 U7.10(VIN) U7.11(VIN) U7.13(PS/SYNC) U10.10(OUT) U10.11(OUT)
VCC_-5V: C?#7.2 C?#16.2 C?#17.2 C?#24.1 C?#25.1 C?#28.2 U?#3.1(OUT) U?#5.2(IN) U?#5.3(EN)
+BATT_IN: C95.1 H4.1 R61.2 U11.6(BAT) U11.8(SRP)
BAT_EN1: N1.1 R49.2
BAT_EN2: N2.1 R47.2
CH_ADC: R48.2 U10.16(ISET)
CHG: R54.1 R66.1 U10.9(CHG#)
EN1: N1.3 R37.1 U10.6(EN1)
EN2: N2.3 R46.1 U10.5(EN2)
GPIOT: R58.2 U11.12(GPOUT)
PGOOD: R53.1 R59.1 U10.7(PGOOD#)
SCL: R55.2 U11.2(SCL)
SDA: R56.2 U11.1(SDA)
NetC79_2: C79.2 R14.2 U7.12(EN)
NetC94_1: C94.1 U11.5(VDD)
NetC97_2: C97.2 U7.1(VINA)
NetC?#8_2: C?#8.2 U?#2.4(NR/FB)
NetC?#15_1: C?#15.1 U?#3.3(CFLY-)
NetC?#15_2: C?#15.2 U?#3.5(CFLY+)
NetC?#35_1: C?#35.1 U?#5.4(NR/FB)
NetC?#36_2: C?#36.2 U?#4.4(NR/FB)
NetL??_1: L??.1 U7.8(L1) U7.9(L1)
NetL??_2: L??.2 U7.6(L2) U7.7(L2)
NetLED2_1: LED2.1(K) R53.2
NetLED3_1: LED3.1(K) R54.2
NetR16_1: R16.1 R62.2 U7.3(FB)
NetR50_1: R50.1 U10.1(TS)
NetR51_1: R51.1 U10.4(CE#)
NetR52_2: R52.2 U10.12(ILIM)
NetR57_2: R57.2 U10.14(TMR)
NetR60_2: R60.2 U11.10(BIN)

Not connected (* = marked no-connect by the designer): U7 14(PG)*; U11 4(NC)* 9(NC)* 11(NC)*

### Notes on the sheet
- 电池电源开关
- 锂电池充电管理
- 电量计
- (near R48) 快速充电电流为1.5A
- 开尔文连接
- 1.5A
  设置最大电流
  电池负载+ 系统负载
- (near R66) LED2 电源状态：
  输入正常：亮
  输入断开/异常：灭
  LED3 充电状态：
  正在充电：亮
  充满/未充电/断电：灭
- 采用开尔文连接。直接连接到电池端子
  不接入总线
- LDO模块/+5转+3V3
- ldo模块/+5转+2.5
- (near U?#3) ldo模块/+5转-5
- ldo模块/+5转+3.3
- ldo模块/-5转-2.5
- (near L??) BUCK-BOOST/转+5V
- 0.5V

### Library data of the parts
C41-C43 C92 C?#5 C?#7 C?#10-C?#13 C?#16 C?#25 C?#26 C?#28-C?#30 C?#32 C?#34 = C0603: CAP CER 10UF 10V, 10% X5R 0603; Value: 104; Published: 8-Jun-2000; LatestRevisionDate: 17-Jul-2002; LatestRevisionNote: Re-released for DXP Platform.; Publisher: Altium Limited
C55-C59 C68 C79 C97 C?#37 = C0603: Capacitor; Value: 104; Published: 8-Jun-2000; LatestRevisionDate: 17-Jul-2002; LatestRevisionNote: Re-released for DXP Platform.; Publisher: Altium Limited
C93 = C0603: CAP CER 4.7UF 10V, 10% X5R 0603; Value: 104; Published: 8-Jun-2000; LatestRevisionDate: 17-Jul-2002; LatestRevisionNote: Re-released for DXP Platform.; Publisher: Altium Limited
C94 = C1206: Manufacturer: YAGEO(国巨); Symbol: CC1206KKX7R9BB474; Add into BOM: yes; Tolerance: ±10%; Voltage Rated: 50V; Temperature Coefficient: X7R; Device: CC1206KKX7R9BB474; LCSC Part Name: 470nF ±10% 50V; Supplier Part: C277483; Manufacturer Part: CC1206KKX7R9BB474; Supplier Footprint: 1206; JLCPCB Part Class: Extended Part; Datasheet: https://atta.szlcsc.com/upload/public/pdf/source/20181008/C309510_22F155564471FAF6A489F7D68F34234E.pdf; Supplier: LCSC; Convert to PCB: yes; Value: 470nF
C95 C?#6 C?#14 C?#15 C?#17 C?#27 C?#31 C?#36 = C0603: as C5 on sheet ADD1299-V3; Published: 8-Jun-2000; LatestRevisionDate: 17-Jul-2002; LatestRevisionNote: Re-released for DXP Platform.; Publisher: Altium Limited
C?#8 = C0603: CAP CER 10nF 50V, 10% X5R 0805; Value: 104; Published: 8-Jun-2000; LatestRevisionDate: 17-Jul-2002; LatestRevisionNote: Re-released for DXP Platform.; Publisher: Altium Limited
C?#9 C?#24 C?#33 = C0603: CAP CER 2.2UF 16V, 10% X5R 0805; Value: 104; Published: 8-Jun-2000; LatestRevisionDate: 17-Jul-2002; LatestRevisionNote: Re-released for DXP Platform.; Publisher: Altium Limited
C?#18 C?#20 = C0603: as C77 on sheet ESP32; Published: 8-Jun-2000; LatestRevisionDate: 17-Jul-2002; LatestRevisionNote: Re-released for DXP Platform.; Publisher: Altium Limited
C?#19 = C0603: CAP CER 0.1UF 25V, 10% X7R 0603; Value: 104; Published: 8-Jun-2000; LatestRevisionDate: 17-Jul-2002; LatestRevisionNote: Re-released for DXP Platform.; Publisher: Altium Limited
C?#21 C?#23 = C0603: CAP CER 10UF 25V, 10% X7R 0603; Value: 104; Published: 8-Jun-2000; LatestRevisionDate: 17-Jul-2002; LatestRevisionNote: Re-released for DXP Platform.; Publisher: Altium Limited
C?#22 = C0603: CAP CER 4.7uF 25V, 10% X7R 0603; Value: 104; Published: 8-Jun-2000; LatestRevisionDate: 17-Jul-2002; LatestRevisionNote: Re-released for DXP Platform.; Publisher: Altium Limited
C?#35 = C0603: as C2 on sheet ADD1299-V3; Published: 8-Jun-2000; LatestRevisionDate: 17-Jul-2002; LatestRevisionNote: Re-released for DXP Platform.; Publisher: Altium Limited
H2 H4 = PZ254V-11-01P: as H9 on sheet ESP32; Symbol: PZ254V-11-01P; Device: PZ254V-11-01P; LCSC Part Name: 1x1P 间距:2.54mm 方针 直插; Supplier Part: C492400; Manufacturer Part: PZ254V-11-01P; Supplier Footprint: 插件,P=2.54mm; JLCPCB Part Class: Extended Part; Datasheet: https://atta.szlcsc.com/upload/public/pdf/source/20200309/C492400_46876A5B545F5AE6B8D4A09C46E276E8.pdf; Supplier: LCSC; Convert to PCB: yes; Row Spacing: -; Mounting Type: 直插; Number of Rows: 单排; Number of Pins: 1P; Current Rating: -; Voltage Rating (Max): -; Length of Mating Pin: 6mm; Insulation Height: 2.5mm; Length of End Connection Pin: 3mm; Contact Material: 黄铜; Contact Plating: -; Operating Temperature: -40℃~+105℃; Color: 黑色
L?? = xfl4020-152mec: 电感值:1.5uH;精度:±20%;额定电流:-;饱和电流(Isat):-;类型:磁胶屏蔽电感;; Manufacturer: Coilcraft(线艺); AddInBom: yes; ModelId: 917e580a727645d0bd5a33a187108a81; ModelTransform: 157.48,157.484,0,0,0,0,0,0,0; Value: 1.5uH; Tolerance: ±20%; Type: 磁胶屏蔽电感; Symbol: XFL4020-152MEC; LCSC Part Name: 1.5uH ±20%; SupplierPart: C3033018; ManufacturerPart: XFL4020-152MEC; Supplier Footprint: SMD,4x4mm; JLCPCB Part Class: Extended Part; Datasheet: https://www.coilcraft.com/getmedia/50632d43-da1b-4cdb-8ab4-3029cab51df3/xfl4020.pdf; Supplier: LCSC; ConvertToPcb: yes; FootprintName: IND-SMD_L4.0-W4.0-A; ModelName: IND-SMD_L4.0-W4.0-A; Current Rating: -; Current - Saturation(Isat): -; DC Resistance(DCR): -; Ratings: -
LED2 LED3 = XL-1608SURC-06: as LED1 on sheet ESP32; Symbol: XL-1608SURC-06; Device: XL-1608SURC-06; LCSC Part Name: XL-1608SURC-06; Supplier Part: C965799; Manufacturer Part: XL-1608SURC-06; Supplier Footprint: 0603; JLCPCB Part Class: Extended Part; Datasheet: https://atta.szlcsc.com/upload/public/pdf/source/20250213/F9766CE804AF391355DCDD48DB3E0DAB.pdf; Supplier: LCSC; Convert to PCB: yes; Lamp Holder Type: -; Diode Configuration: -; Color Temperature: -; Operating Temperature: -20℃~+85℃
R14 R16 R62 = R0603: Resistor; Published: 8-Jun-2000; LatestRevisionDate: 17-Jul-2002; LatestRevisionNote: Re-released for DXP Platform.; Publisher: Altium Limited
R37 R46 R47 R49-R51 R58 R60 = R0603: RES 12K OHM 1/10W 1% 0603 SMD; Published: 8-Jun-2000; LatestRevisionDate: 17-Jul-2002; LatestRevisionNote: Re-released for DXP Platform.; Publisher: Altium Limited
R48 = R0603: RES 887 OHM 1/10W 1% 0603 SMD; Published: 8-Jun-2000; LatestRevisionDate: 17-Jul-2002; LatestRevisionNote: Re-released for DXP Platform.; Publisher: Altium Limited
R52 R57 = R0603: RES 1.1K OHM 1/10W 1% 0603 SMD; Published: 8-Jun-2000; LatestRevisionDate: 17-Jul-2002; LatestRevisionNote: Re-released for DXP Platform.; Publisher: Altium Limited
R53 R54 R59 R66 = R0603: RES 1K OHM 1/10W 1% 0603 SMD; Published: 8-Jun-2000; LatestRevisionDate: 17-Jul-2002; LatestRevisionNote: Re-released for DXP Platform.; Publisher: Altium Limited
R55 R56 = R0603: RES 4.7K OHM 1/10W 1% 0603 SMD; Published: 8-Jun-2000; LatestRevisionDate: 17-Jul-2002; LatestRevisionNote: Re-released for DXP Platform.; Publisher: Altium Limited
R61 = RE2512F3R010: 采样电阻; Manufacturer: 捷而瑞; Add into BOM: yes; Value: 10mΩ; Tolerance: ±1%; Power(Watts): 3W; Temperature Coefficient: ±50ppm/℃; Symbol: RE2512F3R010; Device: RE2512F3R010; LCSC Part Name: 10mΩ 3W 2512 ±1%; Supplier Part: C46961753; Manufacturer Part: RE2512F3R010; Supplier Footprint: 2512; JLCPCB Part Class: Extended Part; Datasheet: https://atta.szlcsc.com/upload/public/pdf/source/20250325/401775B85EF7B3A580BC34DFED100CB2.pdf; Supplier: LCSC; Convert to PCB: yes; Type: 采样电阻
U7 = TPS63020DSJR: Manufacturer: TI(德州仪器); Add into BOM: yes; Function: 升降压型; Output Type: 可调; Voltage - Supply: 1.8V~5.5V; Output Voltage: 1.2V~5.5V; Output Current: 3A; Frequency - Switching: 2.4MHz; Synchronous Rectifier: 是; Number of Outputs: 1; Topology: 降压-升压式; Quiescent Current: 50uA; Switch tube (built-in/external): 内置; Symbol: TPS63020DSJR; Device: TPS63020DSJR; LCSC Part Name: 高效率单电感升降压转换器; Supplier Part: C15483; Manufacturer Part: TPS63020DSJR; Supplier Footprint: VSON-14-EP(3x4); JLCPCB Part Class: Extended Part; Datasheet: https://www.ti.com/cn/lit/gpn/tps63020; Supplier: LCSC; Convert to PCB: yes; Operating Temperature: -40℃~+85℃@(TA)
U10 = BQ24075TRGTR: Manufacturer: TI(德州仪器); Add into BOM: yes; Symbol: BQ24075TRGTR; Device: BQ24075TRGTR; LCSC Part Name: BQ24075TRGTR; Supplier Part: C544783; Manufacturer Part: BQ24075TRGTR; Supplier Footprint: VQFN-16-EP(3x3); JLCPCB Part Class: Extended Part; Datasheet: https://www.ti.com/cn/lit/gpn/bq24079t; Supplier: LCSC; Convert to PCB: yes
U11 = BQ27441DRZR-G1A: Manufacturer: TI(德州仪器); Add into BOM: yes; Voltage - Supply: 2.45V~4.5V; Charging Saturation Voltage: 4.2V; Type of Battery: 锂离子/聚合物; Number of Cells: 1; Symbol: BQ27441DRZR-G1A; Device: BQ27441DRZR-G1A; LCSC Part Name: BQ27441DRZR-G1A; Supplier Part: C473397; Manufacturer Part: BQ27441DRZR-G1A; Supplier Footprint: SON-12-EP(2.5x4); JLCPCB Part Class: Extended Part; Datasheet: https://www.ti.com/cn/lit/gpn/bq27441-g1; Supplier: LCSC; Convert to PCB: yes
U?#1 = ams1117-3.3_c6186: 输出极性:正极;工作电压:15V;输出电压:3.3V;输出电流:1A;电源纹波抑制比(PSRR):72dB@(120Hz);输出类型:固定;; Manufacturer: Advanced Monolithic Systems; AddInBom: yes; ModelId: 925194bf9823436183a3e0b978a8d076; ModelName: SOT-223-4P_L6.5-W3.5-H1.6-LS7.0-P2.30; ModelTransform: 279.89794,255.905,0,180,0,0,-3.9385,-0.0005,0; Output Configuration: 正极; Voltage - Supply: 15V; Output Voltage: 3.3V; Output Current: 1A; Voltage Dropout: 1.1V@(800mA); standby current: 5mA; Noise: 0.003%Vout; Output Type: 固定; Number of Outputs: 1; LCSC Part Name: 3.3V 1A 15V; SupplierPart: C6186; ManufacturerPart: AMS1117-3.3; Supplier Footprint: SOT-223; JLCPCB Part Class: Basic Part; Datasheet: https://item.szlcsc.com/datasheet/AMS1117-3.3/6652.html; Supplier: LCSC; ConvertToPcb: yes; SymbolName: AMS1117-3.3; FootprintName: SOT-223-3_L6.5-W3.4-P2.30-LS7.0-BR; Power Supply Rejection Ratio (PSRR): 72dB@(120Hz); Features: 短路保护；热关断；过流保护; Operating Temperature: -40℃~+125℃
U?#2 = TPS73225DBVR: Manufacturer: TI(德州仪器); Add into BOM: yes; Output Type: 固定; Maximum Input Voltage: 5.5V; Output Voltage: 2.5V; Output Current: 250mA; Dropout Voltage: 150mV@(250mA); standby current: 550uA; Output Polarity: 正极; Number of Outputs: 1; Symbol: TPS73225DBVR; Device: TPS73225DBVR; LCSC Part Name: 具有反向电流保护和使能功能的 250mA、高精度、超低压降稳压器; Supplier Part: C2758473; Manufacturer Part: TPS73225DBVR; Supplier Footprint: SOT-23-5; JLCPCB Part Class: Extended Part; Datasheet: https://www.ti.com/cn/lit/gpn/tps732; Supplier: LCSC; Convert to PCB: yes; Feature: 防静电保护；过压保护(OVP)；低ESR；热保护(TSD)；过流保护(OCP)；带使能；带电荷泵；防倒灌; Operating Temperature: -40℃~+125℃
U?#3 = TPS60403DBVR: Manufacturer: TI(德州仪器); Add into BOM: yes; Symbol: TPS60403DBVR; Device: TPS60403DBVR; LCSC Part Name: TPS60403DBVR; Supplier Part: C11338; Manufacturer Part: TPS60403DBVR; Supplier Footprint: SOT-23-5; JLCPCB Part Class: Extended Part; Datasheet: https://www.ti.com/cn/lit/gpn/tps60403; Supplier: LCSC; Convert to PCB: yes
U?#4 = TPS73233DBVR: Manufacturer: TI(德州仪器); Add into BOM: yes; Output Type: 固定; Maximum Input Voltage: 5.5V; Output Voltage: 3.3V; Output Current: 250mA; Power Supply Rejection Ratio (PSRR): 58dB@(100Hz)；37dB@(10kHz); Dropout Voltage: 150mV@(250mA); standby current: 550uA; Output Polarity: 正极; Number of Outputs: 1; Symbol: TPS73233DBVR; Device: TPS73233DBVR; LCSC Part Name: 具有反向电流保护和使能功能的 250mA、高精度、超低压降稳压器; Supplier Part: C181459; Manufacturer Part: TPS73233DBVR; Supplier Footprint: SOT-23-5; JLCPCB Part Class: Extended Part; Datasheet: https://www.ti.com/cn/lit/gpn/tps732; Supplier: LCSC; Convert to PCB: yes; Feature: 防静电保护；过压保护(OVP)；低ESR；热保护(TSD)；过流保护(OCP)；带使能；带电荷泵；防倒灌; Operating Temperature: -40℃~+125℃
U?#5 = TPS72325DBVR: Manufacturer: TI(德州仪器); Add into BOM: yes; Output Type: 固定; Maximum Input Voltage: 10V; Output Voltage: 2.5V; Output Current: 200mA; Power Supply Rejection Ratio (PSRR): 65dB; Dropout Voltage: 500mV@(200mA); standby current: 200uA; Output Polarity: 负极; Number of Outputs: 1; Symbol: TPS72325DBVR; Device: TPS72325DBVR; LCSC Part Name: 输入10V 输出2.5V 200mA; Supplier Part: C69932; Manufacturer Part: TPS72325DBVR; Supplier Footprint: SOT-23-5; JLCPCB Part Class: Extended Part; Datasheet: https://www.ti.com/cn/lit/gpn/tps723; Supplier: LCSC; Convert to PCB: yes; Feature: 防静电保护；低ESR；热保护(TSD)；过流保护(OCP)；带使能；防倒灌; Operating Temperature: -40℃~+125℃
N1 N2 = MMTB3904: Part Number: *; Brand: *

## Nets that join several sheets
+V_USB: ESP32 (D1.2 USB1.A4B9 USB1.B4A9), POWER (C41.2 C42.2 U10.13)
ADVDD: ADD1299-V3 (7 pins), POWER (C?#32.2 C?#33.2 C?#34.2 U?#4.5)
AGND: ADD1299-V3 (39 pins), ESP32 (C80.2 C81.1 C82.2), POWER (10 pins)
AVDD: ADD1299-V3 (20 pins), ESP32 (C80.1 U9.7), POWER (C?#9.2 C?#10.2 C?#11.2 U?#2.5)
AVSS: ADD1299-V3 (38 pins), ESP32 (C82.1 U9.4), POWER (C?#26.1 C?#27.1 C?#29.2 U?#5.5)
DGND: ESP32 (U3.1), POWER (5 pins)
DVDD: ADD1299-V3 (U1.48 U1.50), ESP32 (10 pins), POWER (10 pins)
GND: ADD1299-V3 (24 pins), ESP32 (23 pins), POWER (56 pins)
CH_ADC: ESP32 (U3.6), POWER (R48.2 U10.16)
DRDY: ADD1299-V3 (U2.47), ESP32 (U3.31)
GPIOT: ESP32 (U3.7), POWER (R58.2 U11.12)
PWDR: ADD1299-V3 (U1.35 U2.35), ESP32 (U3.35)
REF: ADD1299-V3 (H1.1 H3.1 R17.2 R64.2), ESP32 (C81.2 U9.2 U9.6)
RESET: ADD1299-V3 (U1.36 U2.36), ESP32 (U3.34)
SCL: ESP32 (U3.4), POWER (R55.2 U11.2)
SDA: ESP32 (U3.5), POWER (R56.2 U11.1)
SPI_CLK: ADD1299-V3 (U1.40 U2.40), ESP32 (U3.29)
SPI_MISO: ADD1299-V3 (U1.43 U2.43), ESP32 (U3.30)
SPI_MOSI: ADD1299-V3 (U1.34 U2.34), ESP32 (U3.28)
START: ADD1299-V3 (U1.38 U2.38), ESP32 (U3.33)